# Altium schematic sheet System_Power_Sheet.SchDoc (part 1 of 2)
size 420 x 297 mm; SheetNumber: 2; SheetTotal: 6
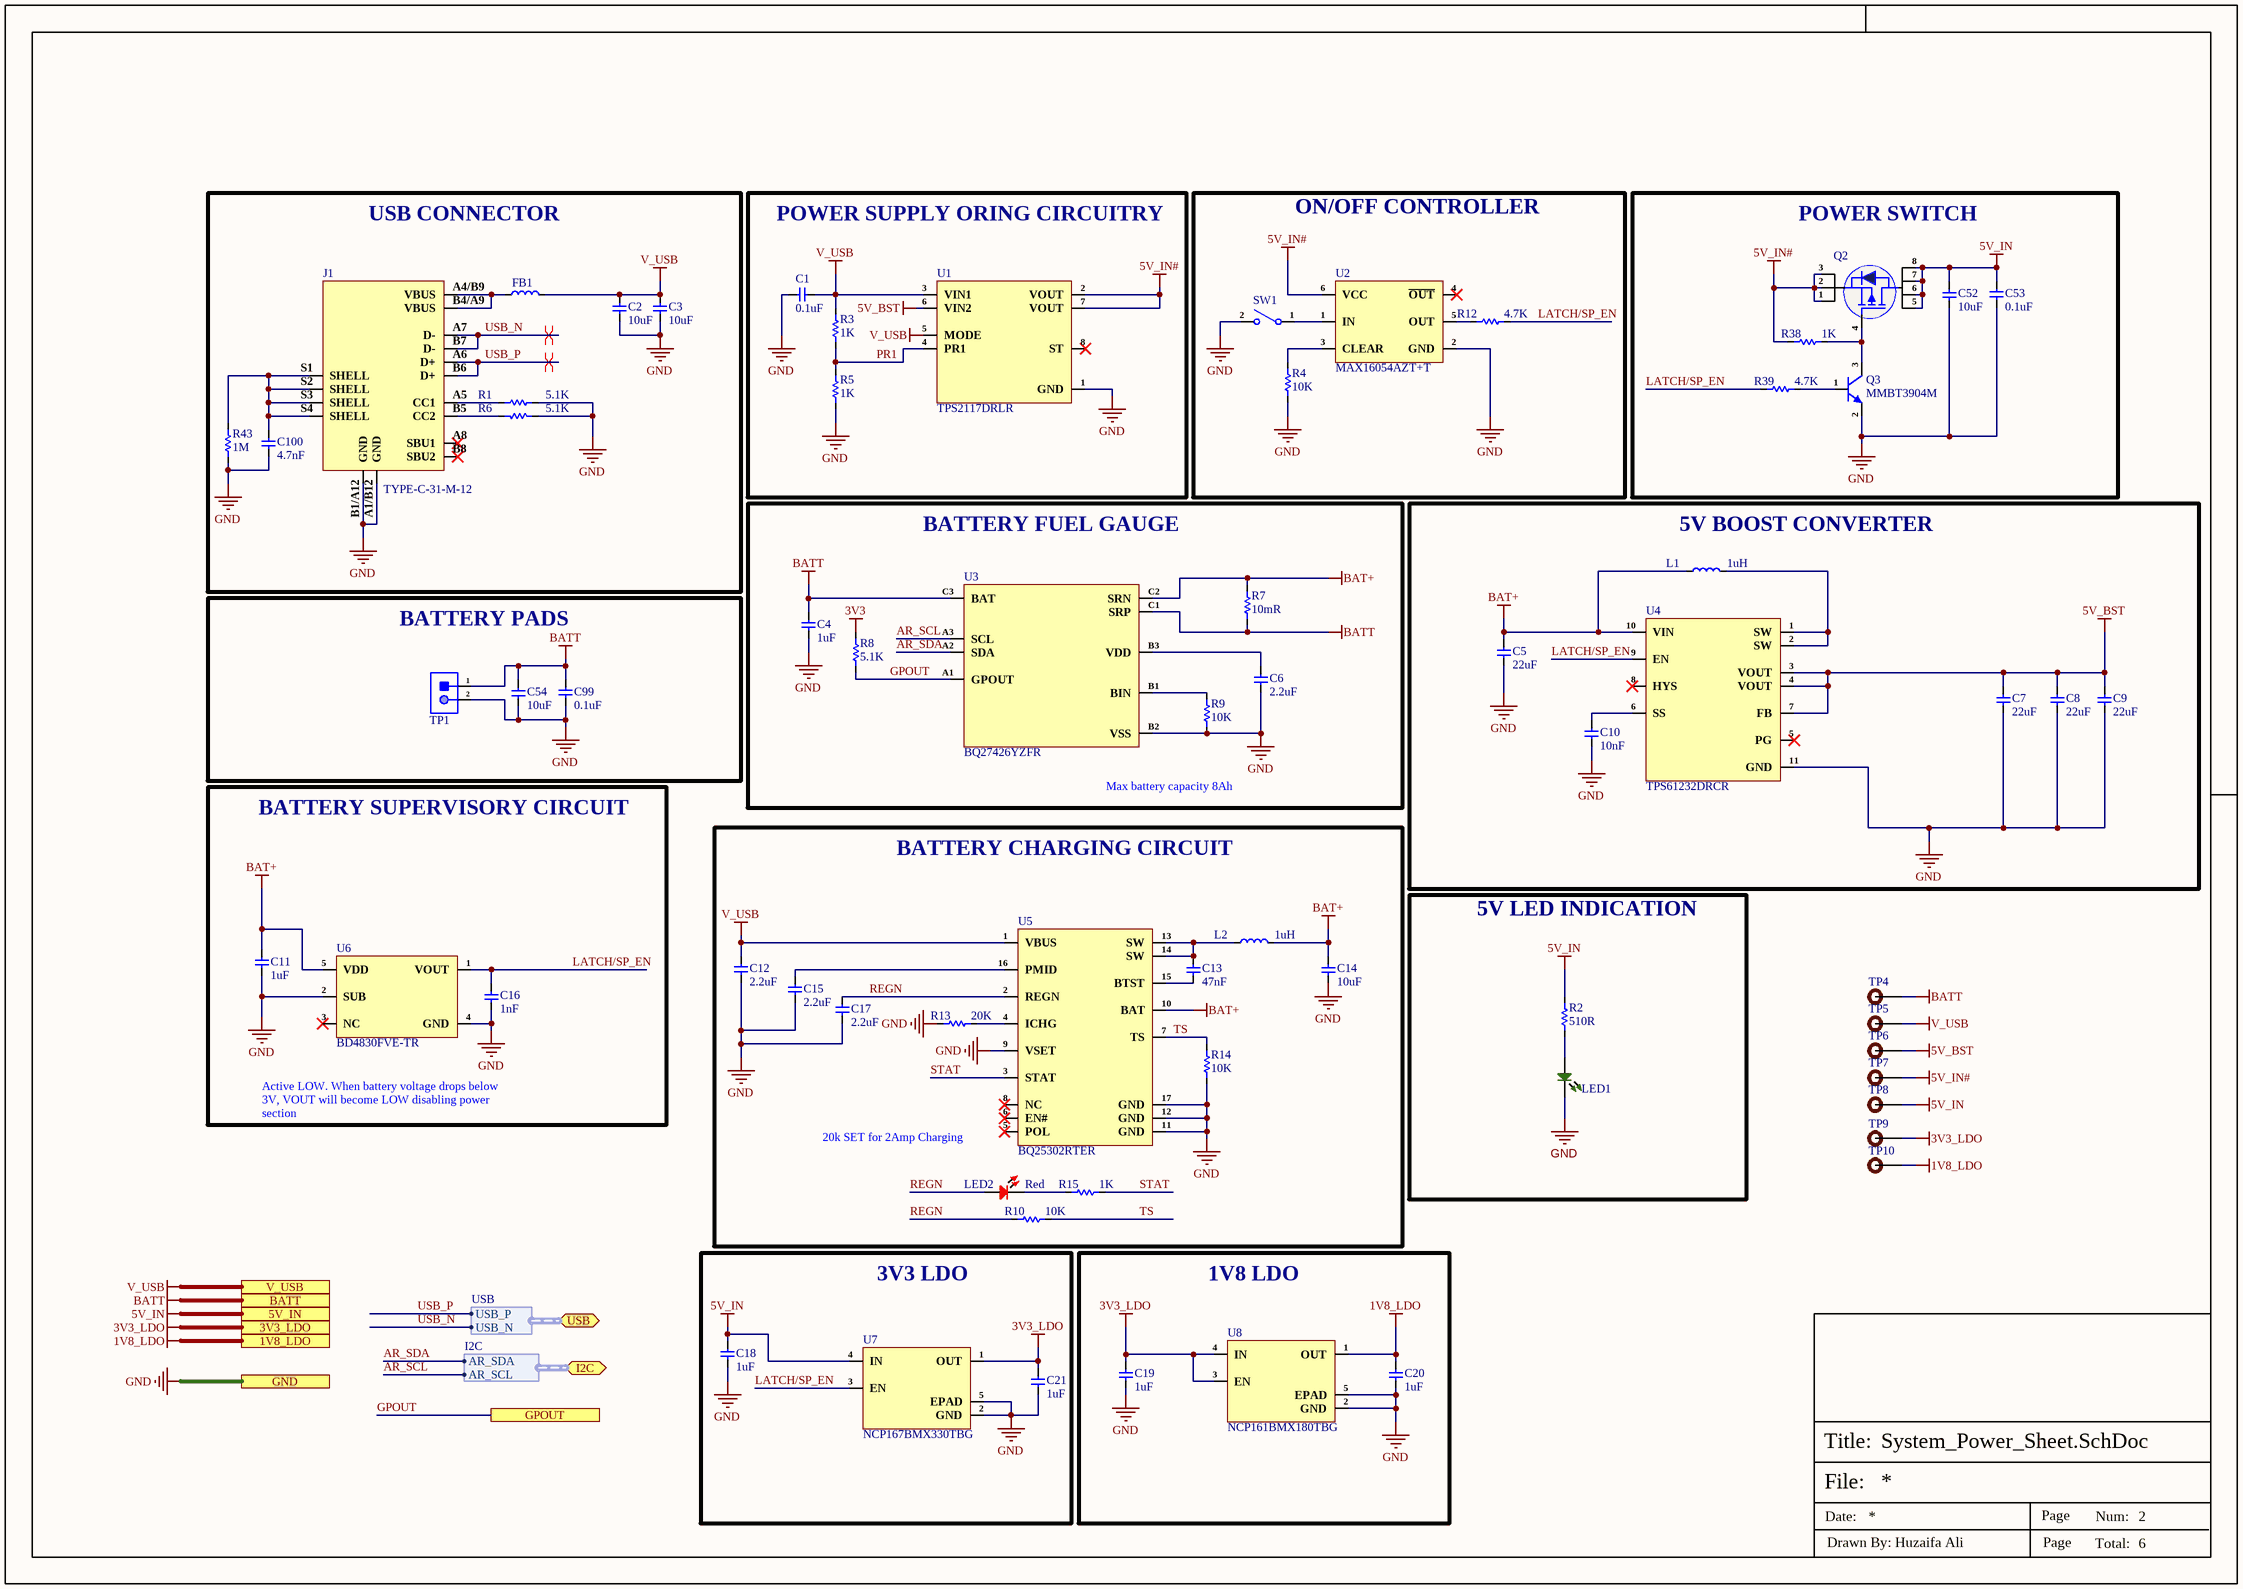
[diagram p0: System_Power_Sheet.SchDoc]

## Parts
C1  0.1uF  [Cap-0402]
C2  10uF  [Cap-0603]
C3  10uF  [Cap-0603]
C4  1uF  [Cap-0402]
C5  22uF  [Cap-0603]
C6  2.2uF  [CAP-0603]
C7  22uF  [Cap-0603]
C8  22uF  [Cap-0603]
C9  22uF  [Cap-0603]
C10  10nF  [Cap-0402]
C11  1uF  [Cap-0402]
C12  2.2uF  [CAP-0603]
C13  47nF  [Cap-0402]
C14  10uF  [Cap-0603]
C15  2.2uF  [CAP-0603]
C16  1nF  [CAP-0201]
C17  2.2uF  [CAP-0603]
C18  1uF  [Cap-0402]
C19  1uF  [Cap-0402]
C20  1uF  [Cap-0402]
C21  1uF  [Cap-0402]
C52  10uF  [Cap-0603]
C53  0.1uF  [Cap-0402]
C54  10uF  [Cap-0603]
C99  0.1uF  [Cap-0402]
C100  4.7nF  [Cap-1206]
FB1  100MHz  [IND-1206]  (value not drawn)
J1  TYPE-C-31-M-12  [TYPE-C-31-M-12_]
L1  1uH  [WPN4020H1R0MT_]
L2  1uH  [WPN4020H1R0MT_]
LED1  XZVG68W-2  [LED-0402]  (value not drawn)
LED2  Red  [LED-0402]
Q2  IRF7410TRPBF  [SOP-8]  (value not drawn)
Q3  MMBT3904M  [SOT-723]
R1  5.1K  [Res-0402]
R2  510R  [Res-0402]
R3  1K  [Res-0201]
R4  10K  [Res-0402]
R5  1K  [Res-0201]
R6  5.1K  [Res-0402]
R7  10mR  [Res-1206]
R8  5.1K  [Res-0402]
R9  10K  [Res-0402]
R10  10K  [Res-0402]
R12  4.7K  [Res-0402]
R13  20K  [Res-0603]
R14  10K  [Res-0402]
R15  1K  [Res-0201]
R38  1K  [Res-0201]
R39  4.7K  [Res-0402]
R43  1M  [Res-0603]
SW1  EVQ-P7A01P  [EVQP7A01P]  (value not drawn)
TP1  2 Test Pad  [2 Test Pad]  (value not drawn)  (no BOM)
TP4  TEST POINT  [Test-point]  (value not drawn)  (no BOM)
TP5  TEST POINT  [Test-point]  (value not drawn)  (no BOM)
TP6  TEST POINT  [Test-point]  (value not drawn)  (no BOM)
TP7  TEST POINT  [Test-point]  (value not drawn)  (no BOM)
TP8  TEST POINT  [Test-point]  (value not drawn)  (no BOM)
TP9  TEST POINT  [Test-point]  (value not drawn)  (no BOM)
TP10  TEST POINT  [Test-point]  (value not drawn)  (no BOM)
U1  TPS2117DRLR  [SOT-583]
U2  MAX16054AZT+T  [TSOT-23-6]
U3  BQ27426YZFR  [DSBGA-9 (1.651x1.61)]
U4  TPS61232DRCR  [10-VSON (3x3)]
U5  BQ25302RTER  [16-QFN (3x3).]
U6  BD4830FVE-TR  [5-VSOF]
U7  NCP167BMX330TBG  [4-UDFN (1.0x1.0)]
U8  NCP161BMX180TBG  [4-UDFN (1.0x1.0)]

## Blocks framed on the sheet
USB CONNECTOR: C2 C3 C100 FB1 J1 R1 R6 R43
POWER SUPPLY ORING CIRCUITRY: C1 R3 R5 U1
ON/OFF CONTROLLER: R4 R12 SW1 U2
POWER SWITCH: C52 C53 Q2 Q3 R38 R39
BATTERY FUEL GAUGE: C4 C6 R7-R9 U3
5V BOOST CONVERTER: C5 C7-C10 L1 U4
BATTERY PADS: C54 C99 TP1
BATTERY SUPERVISORY CIRCUIT: C11 C16 U6
BATTERY CHARGING CIRCUIT: C12-C15 C17 L2 LED2 R10 R13-R15 U5
5V LED INDICATION: LED1 R2
3V3 LDO: C18 C21 U7
1V8 LDO: C19 C20 U8

## Ports
1V8_LDO, 3V3_LDO, 5V_IN, BATT, GND, GPOUT, I2C (bidir, harness I2C), USB (bidir, harness USB), V_USB

## Harnesses
USB: USB_P, USB_N
I2C: AR_SDA, AR_SCL

## Nets
1V8_LDO: C20.2 TP10.1 U8.1(OUT) ; port 1V8_LDO
3V3: R8.2
3V3_LDO: C19.2 C21.2 TP9.1 U7.1(OUT) U8.3(EN) U8.4(IN) ; port 3V3_LDO
5V_BST: C7.2 C8.2 C9.2 TP6.1 U1.6(VIN2) U4.3(VOUT) U4.4(VOUT) U4.7(FB)
5V_IN: C18.1 C52.2 C53.1 Q2.5(D) Q2.6(D) Q2.7(D) Q2.8(D) R2.2 TP8.1 U7.4(IN) ; port 5V_IN
5V_IN#: Q2.1(S) Q2.2(S) Q2.3(S) R38.2 TP7.1 U1.2(VOUT) U1.7(VOUT) U2.6(VCC)
BAT+: C5.2 C11.1 C14.2 L1.1 L2.2 R7.2 U3.C2(SRN) U4.10(VIN) U5.10(BAT) U6.5(VDD)
BATT: C4.1 C54.2 C99.1 R7.1 TP1.1 TP4.1 U3.C1(SRP) U3.C3(BAT) ; port BATT
GND: C1.2 C2.1 C3.1 C4.2 C5.1 C6.1 C7.1 C8.1 C9.1 C10.1 C11.2 C12.2 C14.1 C15.2 C16.1 C17.2 C18.2 C19.1 C20.1 C21.1 C52.1 C53.2 C54.1 C99.2 C100.1 J1.A1/B12(GND) J1.B1/A12(GND) LED1.2 Q3.2(E) R1.1 R4.1 R5.1 R6.1 R9.1 R13.1 R14.1 R43.1 SW1.2 TP1.2 U1.1(GND) U2.2(GND) U3.B2(VSS) U4.11(GND) U5.9(VSET) U5.11(GND) U5.12(GND) U5.17(GND) U6.2(SUB) U6.4(GND) U7.2(GND) U7.5(EPAD) U8.2(GND) U8.5(EPAD) ; port GND
V_USB: C1.1 C2.2 C3.2 C12.1 FB1.2 R3.2 TP5.1 U1.3(VIN1) U1.5(MODE) U5.1(VBUS) ; port V_USB
AR_SCL: U3.A3(SCL) ; port I2C.AR_SCL
AR_SDA: U3.A2(SDA) ; port I2C.AR_SDA
GPOUT: R8.1 U3.A1(GPOUT) ; port GPOUT
LATCH/SP_EN: C16.2 R12.1 R39.2 U4.9(EN) U6.1(VOUT) U7.3(EN)
PR1: R3.1 R5.2 U1.4(PR1)
REGN: C17.1 LED2.1 R10.2 U5.2(REGN)
STAT: R15.1 U5.3(STAT)
TS: R10.1 R14.2 U5.7(TS)
USB_N: J1.A7(D-) J1.B7(D-) ; port USB.USB_N
USB_P: J1.A6(D+) J1.B6(D+) ; port USB.USB_P
NetC6_2: C6.2 U3.B3(VDD)
NetC10_2: C10.2 U4.6(SS)
NetC13_1: C13.1 U5.15(BTST)
NetC13_2: C13.2 L2.1 U5.13(SW) U5.14(SW)
NetC15_1: C15.1 U5.16(PMID)
NetC100_2: C100.2 J1.S1(SHELL) J1.S2(SHELL) J1.S3(SHELL) J1.S4(SHELL) R43.2
NetFB1_1: FB1.1 J1.A4/B9(VBUS) J1.B4/A9(VBUS)
NetJ1_A5: J1.A5(CC1) R1.2
NetJ1_B5: J1.B5(CC2) R6.2
NetL1_2: L1.2 U4.1(SW) U4.2(SW)
NetLED1_1: LED1.1 R2.1
NetLED2_2: LED2.2 R15.2
NetQ2_4: Q2.4(G) Q3.3(C) R38.1
NetQ3_1: Q3.1(B) R39.1
NetR4_2: R4.2 U2.3(CLEAR)
NetR9_2: R9.2 U3.B1(BIN)
NetR12_2: R12.2 U2.5(OUT)
NetR13_2: R13.2 U5.4(ICHG)
NetSW1_1: SW1.1 U2.1(IN)

Not connected (* = marked no-connect by the designer): J1 A8(SBU1)* B8(SBU2)*; U1 8(ST)*; U2 4(~{OUT})*; U4 5(PG)* 8(HYS)*; U5 5(POL)* 6(EN#)* 8(NC)*; U6 3(NC)*

## Layout directives
differential pair; net class USB; differential pair class USB_Lines; rule Impedance Constraint [Min = 88.00    Max = 90.00    ]; rule Matched Net Lengths [Tolerance = 20mil]: USB_N, USB_P

## Notes on the sheet
- Max battery capacity 8Ah
- Active LOW. When battery voltage drops below 3V, VOUT will become LOW disabling power section
- 20k SET for 2Amp Charging
- File:
- Title:
- Date:
- Page
- Num:
- Total:
- Drawn By: Huzaifa Ali